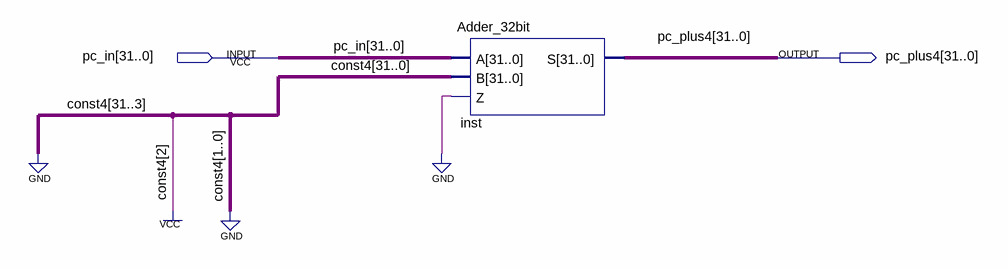
[diagram p0: schematic sheet]
// Quartus schematic PC_Plus4.bdf as structural Verilog: 1 symbols, 2 pins
module PC_Plus4 (
  input  [31:0] pc_in,
  output [31:0] pc_plus4
);

  Adder_32bit inst (.A(pc_in), .B(32'b00000000000000000000000000000100), .Z(1'b0), .S(pc_plus4));
endmodule
